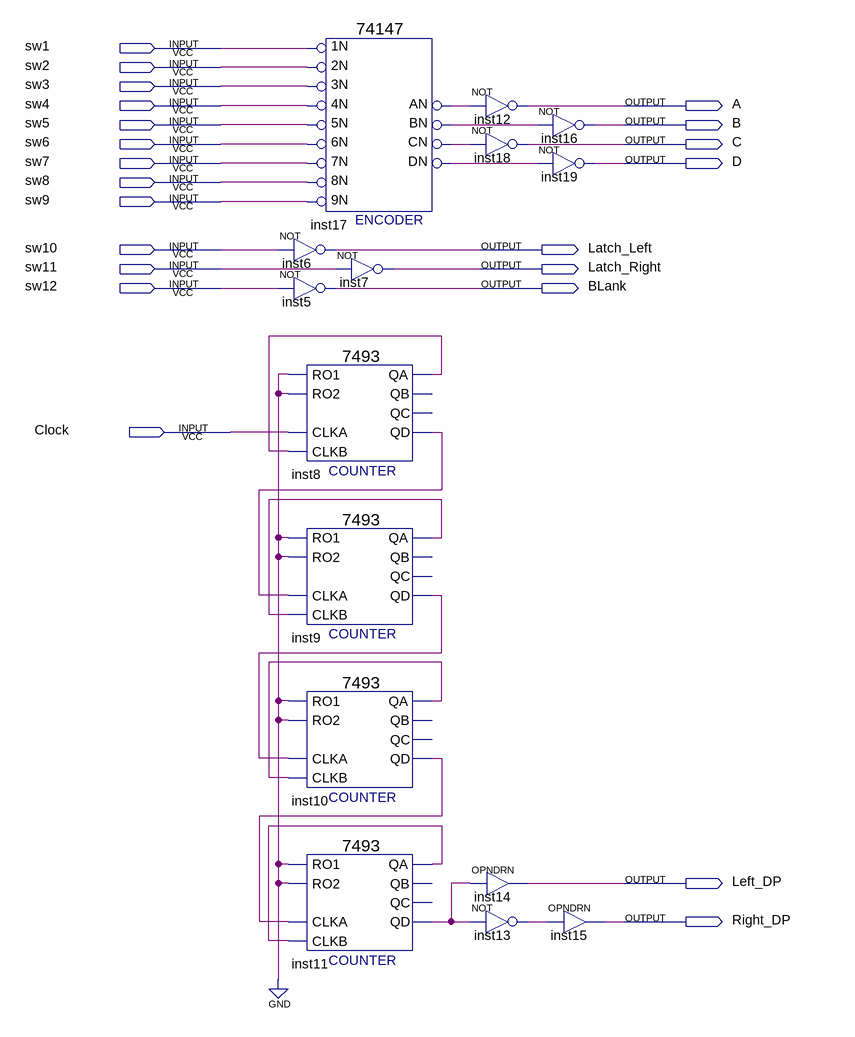
[diagram p0: schematic sheet]
// Quartus schematic board-test-2.bdf as structural Verilog: 15 symbols, 22 pins
module \board-test-2  (
  input  sw1,
  input  sw2,
  input  sw3,
  input  sw4,
  input  sw5,
  input  sw6,
  input  sw7,
  input  sw8,
  input  sw9,
  input  sw10,
  input  sw11,
  input  sw12,
  input  Clock,
  output A,
  output B,
  output C,
  output D,
  output Latch_Left,
  output Latch_Right,
  output BLank,
  output Left_DP,
  output Right_DP
);

  wire inst8_qa, inst8_qd, inst9_qa, inst9_qd, inst10_qa, inst10_qd, inst11_qa, inst11_qd, inst13_out,
       inst17_an, inst17_bn, inst17_cn, inst17_dn;

  \74147  inst17 (
    .\1N (sw1), .\2N (sw2), .\3N (sw3), .\6N (sw6), .\5N (sw5), .\4N (sw4), .\9N (sw9), .\8N (sw8),
    .\7N (sw7), .CN(inst17_cn), .BN(inst17_bn), .AN(inst17_an), .DN(inst17_dn));
  not inst6 (Latch_Left, sw10);
  not inst5 (BLank, sw12);
  \7493  inst8 (.RO1(1'b0), .RO2(1'b0), .CLKA(Clock), .CLKB(inst8_qa), .QA(inst8_qa), .QD(inst8_qd));  // open: QC, QB
  \7493  inst9 (
    .RO1(1'b0), .RO2(1'b0), .CLKA(inst8_qd), .CLKB(inst9_qa), .QA(inst9_qa), .QD(inst9_qd));  // open: QC, QB
  \7493  inst10 (
    .RO1(1'b0), .RO2(1'b0), .CLKA(inst9_qd), .CLKB(inst10_qa), .QA(inst10_qa), .QD(inst10_qd));  // open: QC, QB
  \7493  inst11 (
    .RO1(1'b0), .RO2(1'b0), .CLKA(inst10_qd), .CLKB(inst11_qa), .QA(inst11_qa), .QD(inst11_qd));  // open: QC, QB
  not inst7 (Latch_Right, sw11);
  not inst12 (A, inst17_an);
  not inst18 (C, inst17_cn);
  OPNDRN inst14 (.IN(inst11_qd), .OUT(Left_DP));
  not inst13 (inst13_out, inst11_qd);
  not inst16 (B, inst17_bn);
  not inst19 (D, inst17_dn);
  OPNDRN inst15 (.IN(inst13_out), .OUT(Right_DP));
endmodule
